# Altium project Interface Board V0.PrjPcb
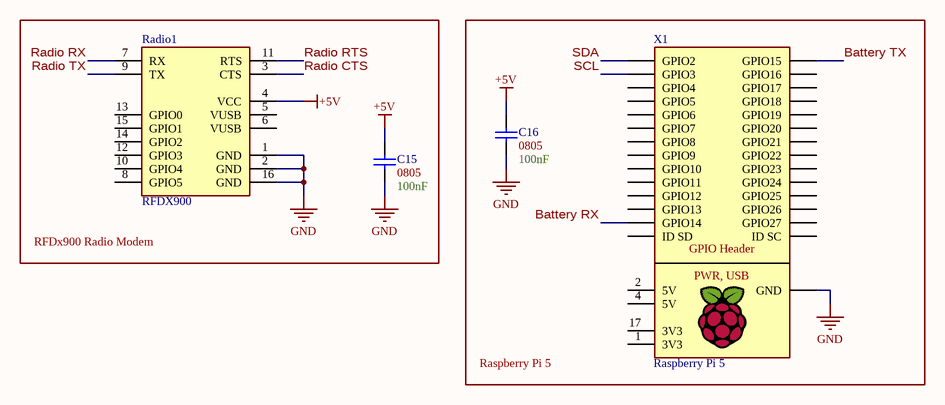
[diagram p0: Raspberry Pi and RF Devices.SchDoc]
5 sheets, 78 parts. Net scope: global (net labels, ports and power ports of the same name join across sheets).
Board file: main.PcbDoc
Sheets:
  Raspberry Pi and RF Devices.SchDoc
  Power.SchDoc
  CubePilot and Motor Drivers.SchDoc
  Peripheral Connections.SchDoc
  Misc.SchDoc

## Sheet Raspberry Pi and RF Devices.SchDoc
size B; SheetNumber: 1; SheetTotal: 5

### Parts
C15  Size Package: 0805  Capacitance: 100nF  [[Cap] SMD 0805]  (hidden comment: SMD Nonpolarized)
C16  Size Package: 0805  Capacitance: 100nF  [[Cap] SMD 0805]  (hidden comment: SMD Nonpolarized)
Radio1  RFDX900  [[Device] RFDX900 Radio]
X1  Raspberry Pi 5  [[Device] Raspberry Pi 5]

### Blocks framed on the sheet
RFDx900 Radio Modem: C15 Radio1
Raspberry Pi 5: C16 X1

### Nets
+5V: C15.1 C16.1 Radio1.4(VCC)
GND: C15.2 C16.2 Radio1.1(GND) Radio1.2(GND) Radio1.16(GND) X1.GND
Battery RX: X1.8(GPIO14)
Battery TX: X1.10(GPIO15)
Radio CTS: Radio1.3(CTS)
Radio RTS: Radio1.11(RTS)
Radio RX: Radio1.7(RX)
Radio TX: Radio1.9(TX)
SCL: X1.5(GPIO3)
SDA: X1.3(GPIO2)

Not connected (* = marked no-connect by the designer): Radio1 5(VUSB) 6(VUSB) 8(GPIO5) 10(GPIO4) 12(GPIO3) 13(GPIO0) 14(GPIO2) 15(GPIO1); X1 1(3V3) 2(5V) 4(5V) 7(GPIO4) 11(GPIO17) 12(GPIO18) 13(GPIO27) 15(GPIO22) 16(GPIO23) 17(3V3) 18(GPIO24) 19(GPIO10) 21(GPIO9) 22(GPIO25) 23(GPIO11) 24(GPIO7) 26(GPIO8) 27(ID_SD) 28(ID_SC) 29(GPIO5) 31(GPIO6) 32(GPIO12) 33(GPIO13) 35(GPIO19) 36(GPIO16) 37(GPIO26) 38(GPIO20) 40(GPIO21)

### Notes on the sheet
- (in symbol [Device] Raspberry Pi 5) GPIO Header; PWR, USB

### Library data of the parts
C15 C16 = [Cap] SMD Nonpolarized
Radio1 = [Device] RFDX900 Radio: RFDX900 Long-Range RF Module
X1 = [Device] Raspberry Pi 5

## Sheet Power.SchDoc
size A; SheetNumber: 2; SheetTotal: 5
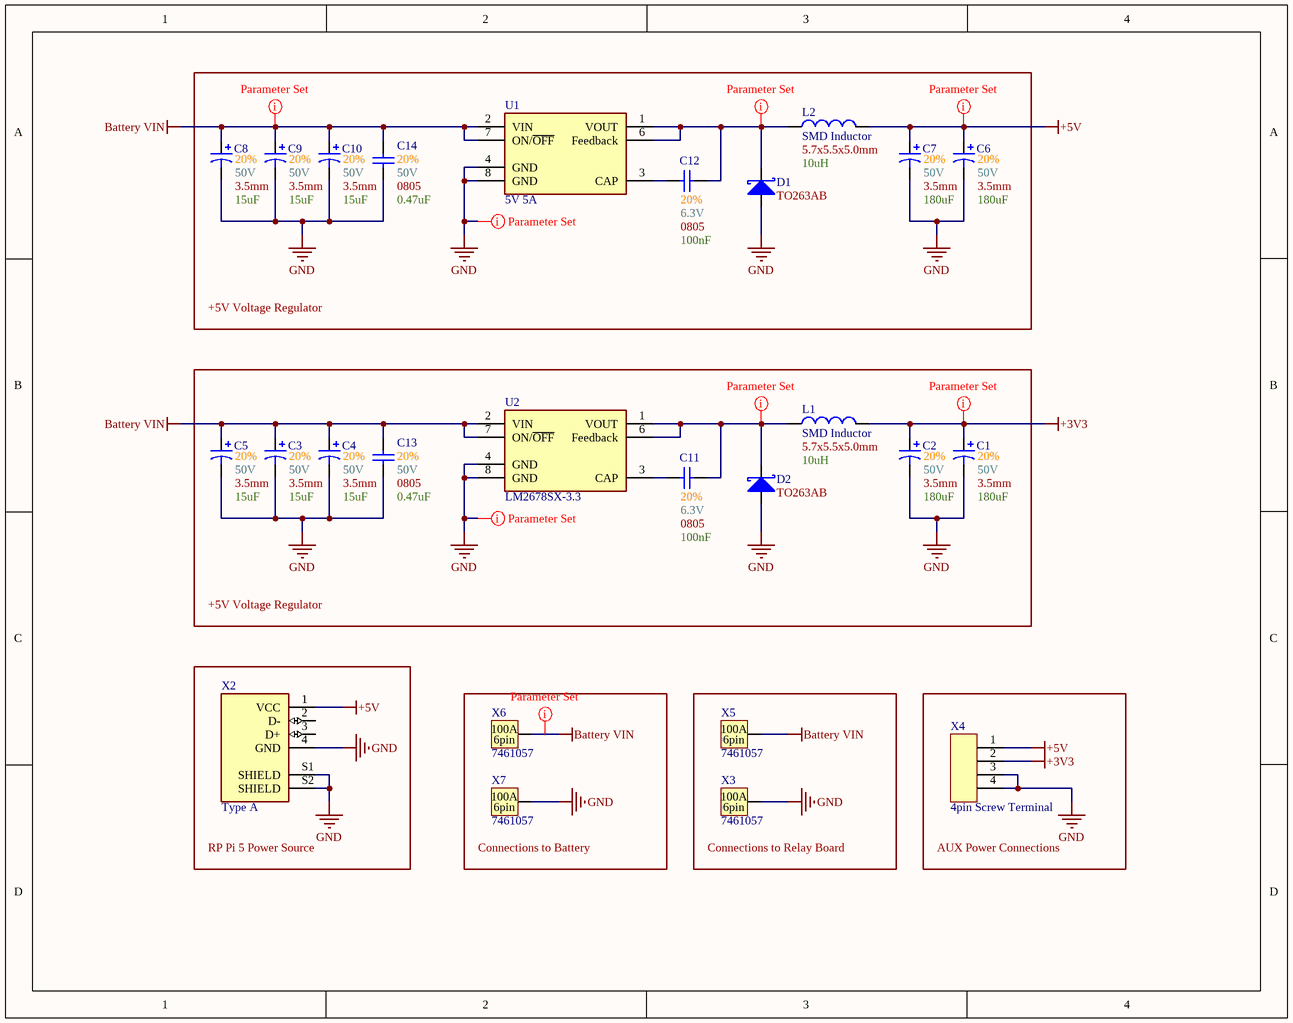
[diagram p1: Power.SchDoc]

### Parts
C1  Tolerance: 20%  Voltage: 50V  Pin Spacing: 3.5mm  Capacitance: 180uF  [[Cap] Thru-Hole Polarized 3.5mm]  (hidden comment: Thru-Hole Polarized)
C2  Tolerance: 20%  Voltage: 50V  Pin Spacing: 3.5mm  Capacitance: 180uF  [[Cap] Thru-Hole Polarized 3.5mm]  (hidden comment: Thru-Hole Polarized)
C3  Tolerance: 20%  Voltage: 50V  Pin Spacing: 3.5mm  Capacitance: 15uF  [[Cap] Thru-Hole Polarized 3.5mm]  (hidden comment: Thru-Hole Polarized)
C4  Tolerance: 20%  Voltage: 50V  Pin Spacing: 3.5mm  Capacitance: 15uF  [[Cap] Thru-Hole Polarized 3.5mm]  (hidden comment: Thru-Hole Polarized)
C5  Tolerance: 20%  Voltage: 50V  Pin Spacing: 3.5mm  Capacitance: 15uF  [[Cap] Thru-Hole Polarized 3.5mm]  (hidden comment: Thru-Hole Polarized)
C6  Tolerance: 20%  Voltage: 50V  Pin Spacing: 3.5mm  Capacitance: 180uF  [[Cap] Thru-Hole Polarized 3.5mm]  (hidden comment: Thru-Hole Polarized)
C7  Tolerance: 20%  Voltage: 50V  Pin Spacing: 3.5mm  Capacitance: 180uF  [[Cap] Thru-Hole Polarized 3.5mm]  (hidden comment: Thru-Hole Polarized)
C8  Tolerance: 20%  Voltage: 50V  Pin Spacing: 3.5mm  Capacitance: 15uF  [[Cap] Thru-Hole Polarized 3.5mm]  (hidden comment: Thru-Hole Polarized)
C9  Tolerance: 20%  Voltage: 50V  Pin Spacing: 3.5mm  Capacitance: 15uF  [[Cap] Thru-Hole Polarized 3.5mm]  (hidden comment: Thru-Hole Polarized)
C10  Tolerance: 20%  Voltage: 50V  Pin Spacing: 3.5mm  Capacitance: 15uF  [[Cap] Thru-Hole Polarized 3.5mm]  (hidden comment: Thru-Hole Polarized)
C11  Tolerance: 20%  Size Package: 0805  Capacitance: 100nF  Voltage: 6.3V  [[Cap] SMD 0805]  (hidden comment: SMD Nonpolarized)
C12  Tolerance: 20%  Size Package: 0805  Capacitance: 100nF  Voltage: 6.3V  [[Cap] SMD 0805]  (hidden comment: SMD Nonpolarized)
C13  Tolerance: 20%  Size Package: 0805  Capacitance: 0.47uF  Voltage: 50V  [[Cap] SMD 0805]  (hidden comment: SMD Nonpolarized)
C14  Tolerance: 20%  Size Package: 0805  Capacitance: 0.47uF  Voltage: 50V  [[Cap] SMD 0805]  (hidden comment: SMD Nonpolarized)
D1  Size Package: TO263AB  [[Diode] SMD TO263AB]  (hidden comment: Schottky)
D2  Size Package: TO263AB  [[Diode] SMD TO263AB]  (hidden comment: Schottky)
L1  SMD Inductor  Size Package: 5.7x5.5x5.0mm  Inductance: 10uH  [[Inductor] 5.7 x 5.5 x 5 mm]
L2  SMD Inductor  Size Package: 5.7x5.5x5.0mm  Inductance: 10uH  [[Inductor] 5.7 x 5.5 x 5 mm]
U1  5V 5A  [[Reg] 5V Regulator (3)]
U2  LM2678SX-3.3  [[Reg] 3V3 Regulator (3)]
X2  Type A  [[Port] USB Type-A Female]
X3  7461057  [[Port] Shank Connector (100A)]
X4  4pin Screw Terminal  [[Screw Terminal] 4pin 5mm]
X5  7461057  [[Port] Shank Connector (100A)]
X6  7461057  [[Port] Shank Connector (100A)]
X7  7461057  [[Port] Shank Connector (100A)]

### Blocks framed on the sheet
+5V Voltage Regulator: C6-C10 C12 C14 D1 L2 U1
+5V Voltage Regulator: C1-C5 C11 C13 D2 L1 U2
RP Pi 5 Power Source: X2
Connections to Battery: X6 X7
Connections to Relay Board: X3 X5
AUX Power Connections: X4

### Nets
+3V3: C1.1 C2.1 L1.2 X4.2
+5V: C6.1 C7.1 L2.2 X2.1(VCC) X4.1
Battery VIN: C3.1 C4.1 C5.1 C8.1 C9.1 C10.1 C13.2 C14.2 U1.2(VIN) U1.7(ON/~{OFF}) U2.2(VIN) U2.7(ON/~{OFF}) X5.1 X6.1
GND: C1.2 C2.2 C3.2 C4.2 C5.2 C6.2 C7.2 C8.2 C9.2 C10.2 C13.1 C14.1 D1.2(A) D2.2(A) U1.4(GND) U1.8(GND) U2.4(GND) U2.8(GND) X2.4(GND) X2.S1(SHIELD) X2.S2(SHIELD) X3.1 X4.3 X4.4 X7.1
NetC11_1: C11.1 U2.3(CAP)
NetC11_2: C11.2 D2.1(K) L1.1 U2.1(VOUT) U2.6(Feedback)
NetC12_1: C12.1 U1.3(CAP)
NetC12_2: C12.2 D1.1(K) L2.1 U1.1(VOUT) U1.6(Feedback)

Not connected (* = marked no-connect by the designer): X2 2(D-) 3(D+)

### Layout directives
net class Supply_Nets: +3V3, +5V, Battery VIN, GND, NetC11_2, NetC12_2
net class Motor VOUT: Battery VIN

### Library data of the parts
C1 C2 C6 C7 = [Cap] Thru-Hole Polarized
C3-C5 C8-C10 = [Cap] Thru-Hole Polarized: EEU-FC1H150H
C11-C14 = [Cap] SMD Nonpolarized
D1 D2 = [Diode] SMD Schottky: Generic
L1 L2 = [Inductor] SMD Inductor: JLC Part #: *; Mouser Part #: *
U1 = [Reg] 5V Regulator (3): LM2678SX-5.0/NOPB; Supplier 1: DigiKey; Supplier Part Number 1: LM2678SX-5.0/NOPBCT-ND
U2 = [Reg] 3V3 Regulator (3): LM2678SX-3.3/NOPB; Supplier 1: DigiKey; Supplier Part Number 1: LM2678SX-3.3/NOPBCT-ND
X2 = [Port] USB Type-A Female (Thru-Hole)
X3 X5-X7 = [Port] Shank Connector (100A): 7461057, internal thread
X4 = [Screw Terminal] 4pin

## Sheet CubePilot and Motor Drivers.SchDoc
size A; SheetNumber: 3; SheetTotal: 5
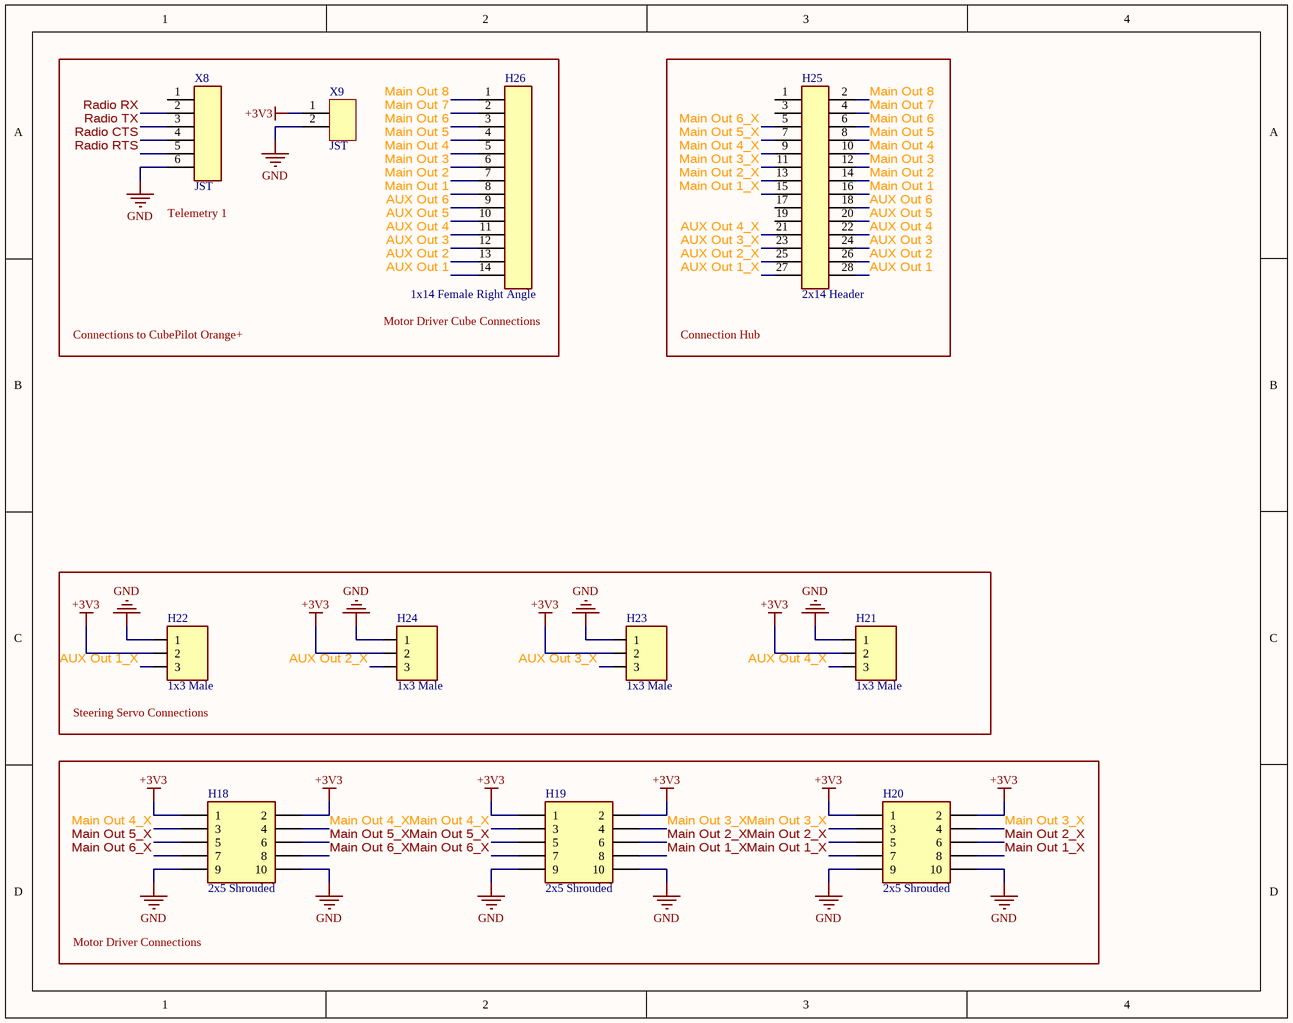
[diagram p2: CubePilot and Motor Drivers.SchDoc]

### Parts
H18  2x5 Shrouded  [[Header] Shrouded 2x5 Male]
H19  2x5 Shrouded  [[Header] Shrouded 2x5 Male]
H20  2x5 Shrouded  [[Header] Shrouded 2x5 Male]
H21  1x3 Male  [[Header] Shrouded 1x3 Male]
H22  1x3 Male  [[Header] Shrouded 1x3 Male]
H23  1x3 Male  [[Header] Shrouded 1x3 Male]
H24  1x3 Male  [[Header] Shrouded 1x3 Male]
H25  2x14 Header  [[Header] 2x14 Male]
H26  1x14 Female Right Angle  [[Header] 1x14 Right Angle Female]
X8  JST  [[JST] 6pin 2.54mm]
X9  JST  [[JST] 2PIN 2.54mm]

### Blocks framed on the sheet
Connection Hub: H25
Steering Servo Connections: H21-H24
Motor Driver Connections: H18-H20

### Nets
+3V3: H18.1 H18.2 H19.1 H19.2 H20.1 H20.2 H21.2 H22.2 H23.2 H24.2 X9.1
GND: H18.9 H18.10 H19.9 H19.10 H20.9 H20.10 H21.1 H22.1 H23.1 H24.1 X8.6 X9.2
AUX Out 1: H25.28 H26.14
AUX Out 1_X: H22.3 H25.27
AUX Out 2: H25.26 H26.13
AUX Out 2_X: H24.3 H25.25
AUX Out 3: H25.24 H26.12
AUX Out 3_X: H23.3 H25.23
AUX Out 4: H25.22 H26.11
AUX Out 4_X: H21.3 H25.21
AUX Out 5: H25.20 H26.10
AUX Out 6: H25.18 H26.9
Main Out 1: H25.16 H26.8
Main Out 1_X: H19.8 H20.7 H20.8 H25.15
Main Out 2: H25.14 H26.7
Main Out 2_X: H19.6 H20.5 H20.6 H25.13
Main Out 3: H25.12 H26.6
Main Out 3_X: H19.4 H20.3 H20.4 H25.11
Main Out 4: H25.10 H26.5
Main Out 4_X: H18.3 H18.4 H19.3 H25.9
Main Out 5: H25.8 H26.4
Main Out 5_X: H18.5 H18.6 H19.5 H25.7
Main Out 6: H25.6 H26.3
Main Out 6_X: H18.7 H18.8 H19.7 H25.5
Main Out 7: H25.4 H26.2
Main Out 8: H25.2 H26.1
Radio CTS: X8.4
Radio RTS: X8.5
Radio RX: X8.2
Radio TX: X8.3

Not connected (* = marked no-connect by the designer): H25 1 3 17 19; X8 1

### Notes on the sheet
- (near X8) Telemetry 1
- Connections to CubePilot Orange+
- (near H26) Motor Driver Cube Connections

### Library data of the parts
H18-H20 = [Header] Shrouded 2x5 Male: BHR-10-VUA
H21-H24 = [Header] Shrouded 1x3 Male: 070543-0037 / Mates with 005057-9403; Supplier 1: DigiKey; Supplier Part Number 1: WM4825-ND
H25 = [Header] 2x14 Male: 2.54mm pitch
H26 = [Header] 1x14 Right Angle Female: 2.54mm pitch
X8 = [JST] 6pin 2.54mm: 2.54mm pitch
X9 = [JST] 2pin 2.54mm: 2.54mm pitch

## Sheet Peripheral Connections.SchDoc
size B; SheetNumber: 4; SheetTotal: 5
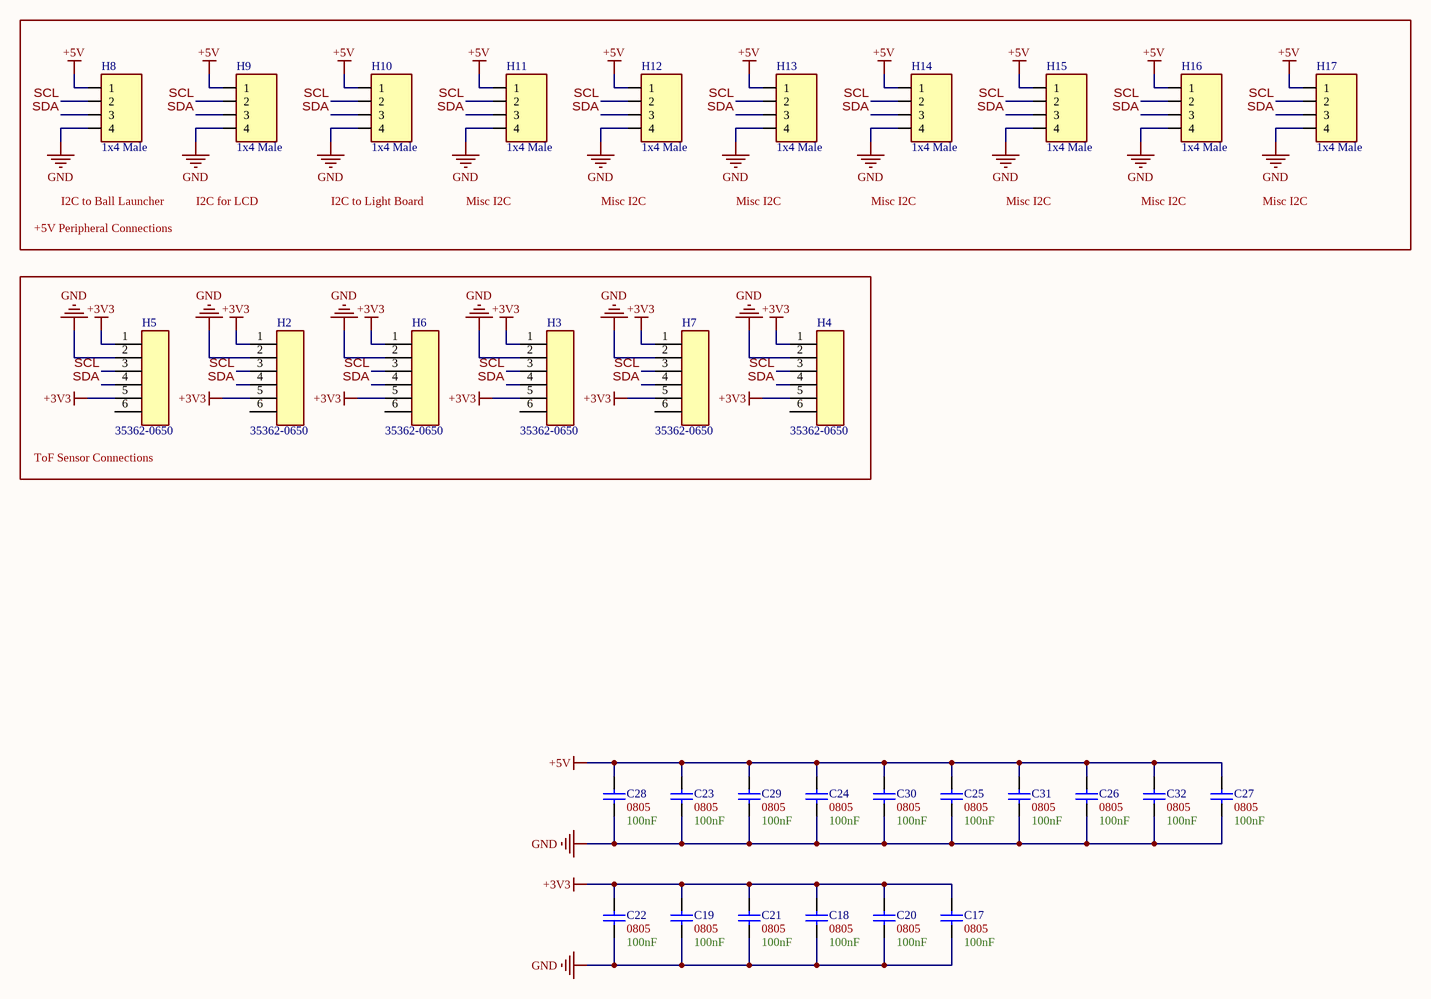
[diagram p3: Peripheral Connections.SchDoc]

### Parts
C17  Size Package: 0805  Capacitance: 100nF  [[Cap] SMD 0805]  (hidden comment: SMD Nonpolarized)
C18  Size Package: 0805  Capacitance: 100nF  [[Cap] SMD 0805]  (hidden comment: SMD Nonpolarized)
C19  Size Package: 0805  Capacitance: 100nF  [[Cap] SMD 0805]  (hidden comment: SMD Nonpolarized)
C20  Size Package: 0805  Capacitance: 100nF  [[Cap] SMD 0805]  (hidden comment: SMD Nonpolarized)
C21  Size Package: 0805  Capacitance: 100nF  [[Cap] SMD 0805]  (hidden comment: SMD Nonpolarized)
C22  Size Package: 0805  Capacitance: 100nF  [[Cap] SMD 0805]  (hidden comment: SMD Nonpolarized)
C23  Size Package: 0805  Capacitance: 100nF  [[Cap] SMD 0805]  (hidden comment: SMD Nonpolarized)
C24  Size Package: 0805  Capacitance: 100nF  [[Cap] SMD 0805]  (hidden comment: SMD Nonpolarized)
C25  Size Package: 0805  Capacitance: 100nF  [[Cap] SMD 0805]  (hidden comment: SMD Nonpolarized)
C26  Size Package: 0805  Capacitance: 100nF  [[Cap] SMD 0805]  (hidden comment: SMD Nonpolarized)
C27  Size Package: 0805  Capacitance: 100nF  [[Cap] SMD 0805]  (hidden comment: SMD Nonpolarized)
C28  Size Package: 0805  Capacitance: 100nF  [[Cap] SMD 0805]  (hidden comment: SMD Nonpolarized)
C29  Size Package: 0805  Capacitance: 100nF  [[Cap] SMD 0805]  (hidden comment: SMD Nonpolarized)
C30  Size Package: 0805  Capacitance: 100nF  [[Cap] SMD 0805]  (hidden comment: SMD Nonpolarized)
C31  Size Package: 0805  Capacitance: 100nF  [[Cap] SMD 0805]  (hidden comment: SMD Nonpolarized)
C32  Size Package: 0805  Capacitance: 100nF  [[Cap] SMD 0805]  (hidden comment: SMD Nonpolarized)
H2  35362-0650  [[Sherlock] 6pin]
H3  35362-0650  [[Sherlock] 6pin]
H4  35362-0650  [[Sherlock] 6pin]
H5  35362-0650  [[Sherlock] 6pin]
H6  35362-0650  [[Sherlock] 6pin]
H7  35362-0650  [[Sherlock] 6pin]
H8  1x4 Male  [[Header] Shrouded 1x4 Male]
H9  1x4 Male  [[Header] Shrouded 1x4 Male]
H10  1x4 Male  [[Header] Shrouded 1x4 Male]
H11  1x4 Male  [[Header] Shrouded 1x4 Male]
H12  1x4 Male  [[Header] Shrouded 1x4 Male]
H13  1x4 Male  [[Header] Shrouded 1x4 Male]
H14  1x4 Male  [[Header] Shrouded 1x4 Male]
H15  1x4 Male  [[Header] Shrouded 1x4 Male]
H16  1x4 Male  [[Header] Shrouded 1x4 Male]
H17  1x4 Male  [[Header] Shrouded 1x4 Male]

### Blocks framed on the sheet
ToF Sensor Connections: H2-H7

### Nets
+3V3: C17.2 C18.2 C19.2 C20.2 C21.2 C22.2 H2.1 H2.5 H3.1 H3.5 H4.1 H4.5 H5.1 H5.5 H6.1 H6.5 H7.1 H7.5
+5V: C23.2 C24.2 C25.2 C26.2 C27.2 C28.2 C29.2 C30.2 C31.2 C32.2 H8.1 H9.1 H10.1 H11.1 H12.1 H13.1 H14.1 H15.1 H16.1 H17.1
GND: C17.1 C18.1 C19.1 C20.1 C21.1 C22.1 C23.1 C24.1 C25.1 C26.1 C27.1 C28.1 C29.1 C30.1 C31.1 C32.1 H2.2 H3.2 H4.2 H5.2 H6.2 H7.2 H8.4 H9.4 H10.4 H11.4 H12.4 H13.4 H14.4 H15.4 H16.4 H17.4
SCL: H2.3 H3.3 H4.3 H5.3 H6.3 H7.3 H8.2 H9.2 H10.2 H11.2 H12.2 H13.2 H14.2 H15.2 H16.2 H17.2
SDA: H2.4 H3.4 H4.4 H5.4 H6.4 H7.4 H8.3 H9.3 H10.3 H11.3 H12.3 H13.3 H14.3 H15.3 H16.3 H17.3

Not connected (* = marked no-connect by the designer): H2 6; H3 6; H4 6; H5 6; H6 6; H7 6

### Notes on the sheet
- +5V Peripheral Connections
- I2C to Ball Launcher
- I2C for LCD
- I2C to Light Board
- Misc I2C

### Library data of the parts
C17-C32 = [Cap] SMD Nonpolarized
H2-H7 = [Sherlock] 6pin: 2.00mm pitch
H8-H16 = [Header] Shrouded 1x4 Male: 70543-0003 / Mates with 0050579404
H17 = [Header] Shrouded 1x4 Male: 70543-0003 / Mates with 005057-9404; Supplier 1: Avnet; Supplier Part Number 1: 0705430003

## Sheet Misc.SchDoc
size A; SheetNumber: 5; SheetTotal: 5
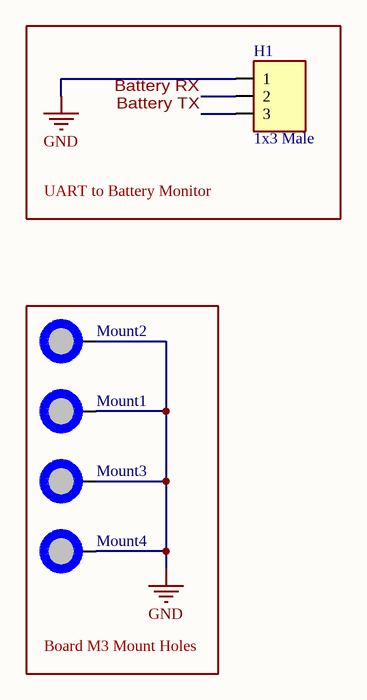
[diagram p4: Misc.SchDoc]

### Parts
H1  1x3 Male  [[Header] Shrouded 1x3 Male]
Mount1  M3 Mount Hole  [[Mount] M3 Mount Hole]  (value not drawn)  (no BOM)
Mount2  M3 Mount Hole  [[Mount] M3 Mount Hole]  (value not drawn)  (no BOM)
Mount3  M3 Mount Hole  [[Mount] M3 Mount Hole]  (value not drawn)  (no BOM)
Mount4  M3 Mount Hole  [[Mount] M3 Mount Hole]  (value not drawn)  (no BOM)

### Blocks framed on the sheet
UART to Battery Monitor: H1
Board M3 Mount Holes: Mount1-Mount4

### Nets
GND: H1.1 Mount1.1 Mount2.1 Mount3.1 Mount4.1
Battery RX: H1.2
Battery TX: H1.3

### Library data of the parts
H1 = [Header] Shrouded 1x3 Male: 070543-0037 / Mates with 005057-9403; Supplier 1: DigiKey; Supplier Part Number 1: WM4825-ND
Mount1-Mount4 = [Mount] M3 Mount Hole: Place at least 4.5mm from board edge. Plated.

## Nets that join several sheets
+3V3: Power (C1.1 C2.1 L1.2 X4.2), CubePilot and Motor Drivers (11 pins), Peripheral Connections (18 pins)
+5V: Raspberry Pi and RF Devices (C15.1 C16.1 Radio1.4), Power (5 pins), Peripheral Connections (20 pins)
GND: Raspberry Pi and RF Devices (6 pins), Power (25 pins), CubePilot and Motor Drivers (12 pins), Peripheral Connections (32 pins), Misc (5 pins)
Battery RX: Raspberry Pi and RF Devices (X1.8), Misc (H1.2)
Battery TX: Raspberry Pi and RF Devices (X1.10), Misc (H1.3)
Radio CTS: Raspberry Pi and RF Devices (Radio1.3), CubePilot and Motor Drivers (X8.4)
Radio RTS: Raspberry Pi and RF Devices (Radio1.11), CubePilot and Motor Drivers (X8.5)
Radio RX: Raspberry Pi and RF Devices (Radio1.7), CubePilot and Motor Drivers (X8.2)
Radio TX: Raspberry Pi and RF Devices (Radio1.9), CubePilot and Motor Drivers (X8.3)
SCL: Raspberry Pi and RF Devices (X1.5), Peripheral Connections (16 pins)
SDA: Raspberry Pi and RF Devices (X1.3), Peripheral Connections (16 pins)